# Altium schematic sheet Sheet3.SchDoc
size A3
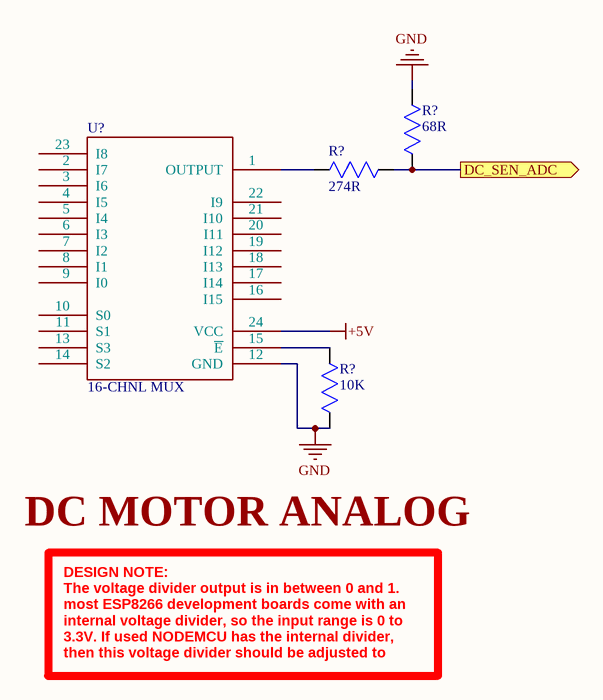
[diagram p0: Sheet3.SchDoc]

## Parts
(Parts that share a designator on the sheet are numbered #1, #2 ... from top to bottom, then left to right.)
?  (no value)  (graphical)
R?#1  274R  [RES_0805]
R?#2  68R  [RES_0805]
R?#3  10K  [RES_0805]
U?  16-CHNL MUX  [SOIC24]

## Ports
DC_SEN_ADC (out)

## Nets
+5V: U?.24(VCC)
GND: R?#2.1 R?#3.2 U?.12(GND)
DC_SEN_ADC: R?#1.1 R?#2.2 ; port DC_SEN_ADC
NetR?#1_2: R?#1.2 U?.1(OUTPUT)
NetR?#3_1: R?#3.1 U?.15(~{E})

Not connected (* = marked no-connect by the designer): U? 2(I7) 3(I6) 4(I5) 5(I4) 6(I3) 7(I2) 8(I1) 9(I0) 10(S0) 11(S1) 13(S3) 14(S2) 16(I15) 17(I14) 18(I13) 19(I12) 20(I11) 21(I10) 22(I9) 23(I8)

## Notes on the sheet
- DC MOTOR ANALOG
- DESIGN NOTE:
  The voltage divider output is in between 0 and 1.  most ESP8266 development boards come with an internal voltage divider, so the input range is 0 to 3.3V. If used NODEMCU has the internal divider, then this voltage divider should be adjusted to 3.3V
- Pievision
- http://www.pievision.com/
- CONFIDENTIAL
- Title:
- Page Contents:
- Variant:
- Size:
- Date:
- DWG NO
- Sheet
- of
- Revision:

## Library data of the parts
? = SDTitleBlock
R?#1 = RES_0805: =Product Description; Product Name: 0805S8F2740T5E; Product Description: RES.(2012) 0805 274 Ohms 1% 1/8W-S 100PPM; Tolerance: ±1%; Watt: 1/8W-S; .Checked PCB: CHK; Package / Case: 0805; Value: 274R; .Checked SCH: CHK
R?#2 = RES_0805: =Product Description; Product Name: 0805S8F680JT5E; Product Description: RES.(2012) 0805 68 Ohms 1% 1/8W-S 200PPM; Tolerance: ±1%; Watt: 1/8W-S; .Checked PCB: CHK; Package / Case: 0805; Value: 68R; .Checked SCH: CHK
R?#3 = RES_0805: =Product Description; Product Name: 0805S8F1002T5E; Product Description: RES.(2012) 0805 10K Ohms 1% 1/8W-S 100PPM; Tolerance: ±1%; Watt: 1/8W-S; .Checked PCB: CHK; Package / Case: 0805; Value: 10K; .Checked SCH: CHK
U? = CD74HC4067M96: = Product Description; Product Description: CD74HC4067 16-CHANNEL ANALOG DIGITAL MULTIPLEXER; Value: CD74HC4067; Package: SOIC24